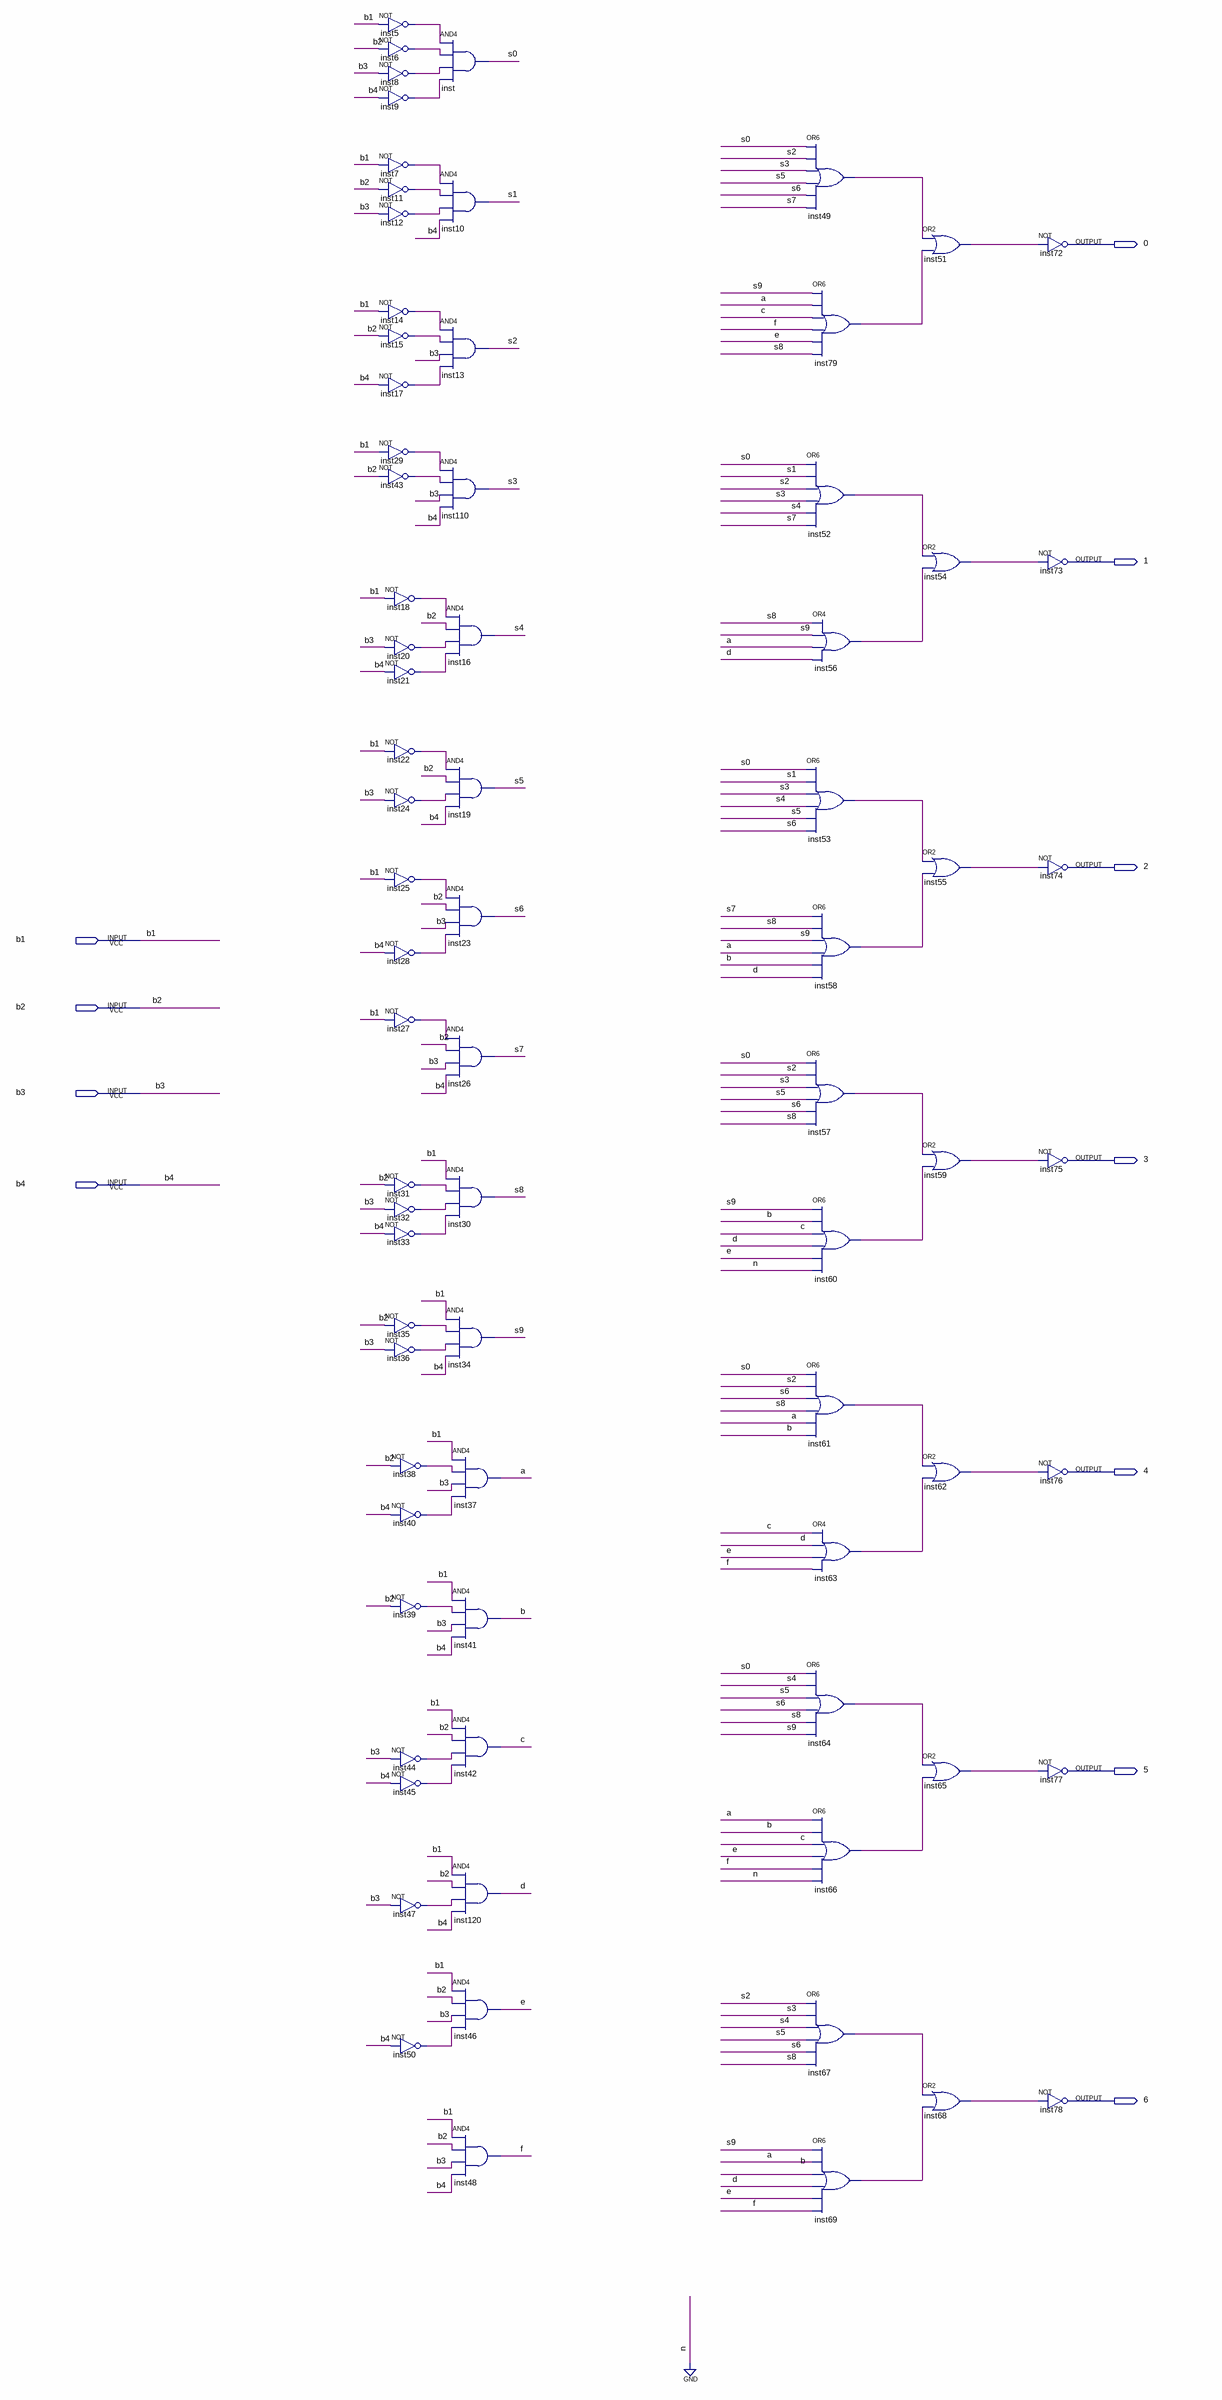
[diagram p0: schematic sheet]
// Quartus schematic display.bdf as structural Verilog: 76 symbols, 11 pins
module display (
  input  b1,
  input  b2,
  input  b3,
  input  b4,
  output \0 ,
  output \1 ,
  output \2 ,
  output \3 ,
  output \4 ,
  output \5 ,
  output \6 
);

  wire a, b, c, d, e, f, inst5_out, inst6_out, inst7_out, inst8_out, inst9_out, inst11_out, inst12_out,
       inst14_out, inst15_out, inst17_out, inst18_out, inst20_out, inst21_out, inst22_out, inst24_out,
       inst25_out, inst27_out, inst28_out, inst29_out, inst31_out, inst32_out, inst33_out, inst35_out,
       inst36_out, inst38_out, inst39_out, inst40_out, inst43_out, inst44_out, inst45_out, inst47_out,
       inst49_out, inst50_out, inst51_out, inst52_out, inst53_out, inst54_out, inst55_out, inst56_out,
       inst57_out, inst58_out, inst59_out, inst60_out, inst61_out, inst62_out, inst63_out, inst64_out,
       inst65_out, inst66_out, inst67_out, inst68_out, inst69_out, inst79_out, s0, s1, s2, s3, s4, s5, s6,
       s7, s8, s9;

  not inst5 (inst5_out, b1);
  not inst6 (inst6_out, b2);
  not inst8 (inst8_out, b3);
  not inst9 (inst9_out, b4);
  not inst7 (inst7_out, b1);
  not inst11 (inst11_out, b2);
  not inst12 (inst12_out, b3);
  not inst14 (inst14_out, b1);
  not inst15 (inst15_out, b2);
  not inst17 (inst17_out, b4);
  not inst29 (inst29_out, b1);
  not inst43 (inst43_out, b2);
  not inst18 (inst18_out, b1);
  not inst20 (inst20_out, b3);
  not inst21 (inst21_out, b4);
  not inst22 (inst22_out, b1);
  not inst24 (inst24_out, b3);
  not inst25 (inst25_out, b1);
  not inst28 (inst28_out, b4);
  not inst27 (inst27_out, b1);
  not inst31 (inst31_out, b2);
  not inst32 (inst32_out, b3);
  not inst33 (inst33_out, b4);
  not inst35 (inst35_out, b2);
  not inst36 (inst36_out, b3);
  not inst38 (inst38_out, b2);
  not inst40 (inst40_out, b4);
  not inst39 (inst39_out, b2);
  not inst44 (inst44_out, b3);
  not inst45 (inst45_out, b4);
  not inst47 (inst47_out, b3);
  not inst50 (inst50_out, b4);
  and inst (s0, inst5_out, inst6_out, inst8_out, inst9_out);
  and inst10 (s1, inst7_out, inst11_out, inst12_out, b4);
  and inst13 (s2, inst14_out, inst15_out, b3, inst17_out);
  and inst110 (s3, inst29_out, inst43_out, b3, b4);
  and inst16 (s4, inst18_out, b2, inst20_out, inst21_out);
  and inst19 (s5, inst22_out, b2, inst24_out, b4);
  and inst23 (s6, inst25_out, b2, b3, inst28_out);
  and inst26 (s7, inst27_out, b2, b3, b4);
  and inst30 (s8, b1, inst31_out, inst32_out, inst33_out);
  and inst34 (s9, b1, inst35_out, inst36_out, b4);
  and inst37 (a, b1, inst38_out, b3, inst40_out);
  and inst41 (b, b1, inst39_out, b3, b4);
  and inst42 (c, b1, b2, inst44_out, inst45_out);
  and inst120 (d, b1, b2, inst47_out, b4);
  and inst46 (e, b1, b2, b3, inst50_out);
  and inst48 (f, b1, b2, b3, b4);
  or inst49 (inst49_out, s0, s2, s3, s5, s6, s7);
  or inst79 (inst79_out, s9, a, c, f, e, s8);
  or inst52 (inst52_out, s0, s1, s2, s3, s4, s7);
  or inst56 (inst56_out, s8, s9, a, d);
  or inst53 (inst53_out, s0, s1, s3, s4, s5, s6);
  or inst58 (inst58_out, s7, s8, s9, a, b, d);
  or inst57 (inst57_out, s0, s2, s3, s5, s6, s8);
  or inst60 (inst60_out, s9, b, c, d, e, 1'b0);
  or inst61 (inst61_out, s0, s2, s6, s8, a, b);
  or inst63 (inst63_out, c, d, e, f);
  or inst64 (inst64_out, s0, s4, s5, s6, s8, s9);
  or inst66 (inst66_out, a, b, c, e, f, 1'b0);
  or inst67 (inst67_out, s2, s3, s4, s5, s6, s8);
  or inst69 (inst69_out, s9, a, b, d, e, f);
  or inst51 (inst51_out, inst49_out, inst79_out);
  or inst54 (inst54_out, inst52_out, inst56_out);
  or inst55 (inst55_out, inst53_out, inst58_out);
  or inst59 (inst59_out, inst57_out, inst60_out);
  or inst62 (inst62_out, inst61_out, inst63_out);
  or inst65 (inst65_out, inst64_out, inst66_out);
  or inst68 (inst68_out, inst67_out, inst69_out);
  not inst72 (\0 , inst51_out);
  not inst73 (\1 , inst54_out);
  not inst74 (\2 , inst55_out);
  not inst75 (\3 , inst59_out);
  not inst76 (\4 , inst62_out);
  not inst77 (\5 , inst65_out);
  not inst78 (\6 , inst68_out);
endmodule
